# Altium schematic sheet RJ45_CAN_PORT.SchDoc
size A
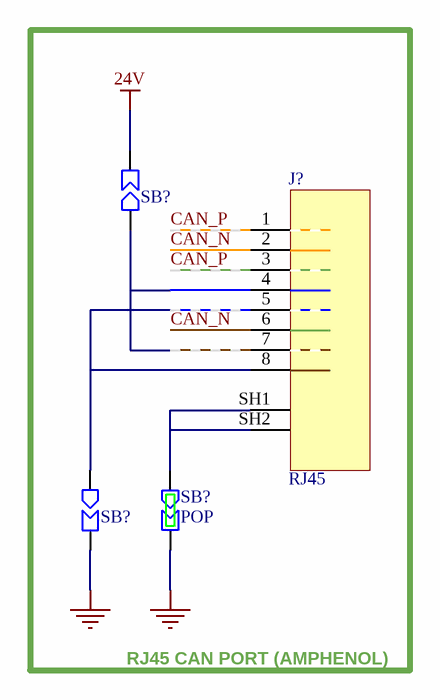
[diagram p0: RJ45_CAN_PORT.SchDoc]

## Parts
(Parts that share a designator on the sheet are numbered #1, #2 ... from top to bottom, then left to right.)
J?  RJ45  [MJB_RJHSE5M80]
SB?#1  solder_bridge_triangular_0603  [solder_bridge_triangular_0603]  (value not drawn)
SB?#2  solder_bridge_triangular_0603  [solder_bridge_triangular_0603]  (value not drawn)
SB?#3  POP  [solder_bridge_triangular_0603]

## Blocks framed on the sheet
RJ45 CAN PORT (AMPHENOL): J? SB?#1-SB?#3

## Nets
24V: SB?#1.2
GND: SB?#2.2 SB?#3.2
CAN_N: J?.2 J?.6
CAN_P: J?.1 J?.3
NetJ?_4: J?.4 J?.7 SB?#1.1
NetJ?_5: J?.5 J?.8 SB?#2.1
NetJ?_SH1: J?.SH1 J?.SH2 SB?#3.1

## Library data of the parts
J? = RJ45_RJHSE5M80: Amphenol Shielded RJ45 Connector
SB?#1 SB?#2 = solder_bridge_triangular_0603: Open Solder Bridge Triangular 0603
SB?#3 = solder_bridge_triangular_0603_POP: POP Open Solder Bridge Triangular 0603 POPULATE